# Vivado block design aurora_gty_47drto13p, xczu47dr-ffvg1517-2-i, Vivado 2025.2
# (continued, part 2 of 3)
current_bd_instance /hier_tx_x0y3/tx_c0
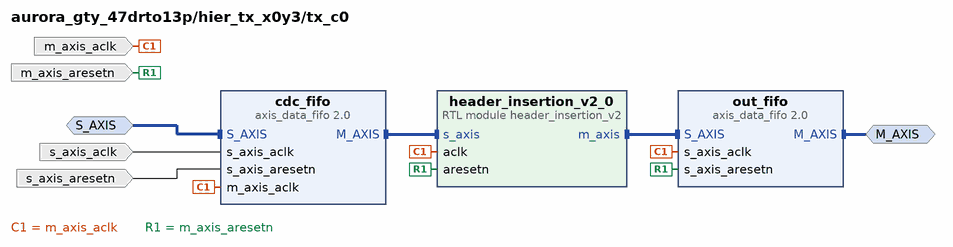
[diagram p24: block diagram inside /hier_tx_x0y3/tx_c0]
create_bd_intf_pin -mode Slave -vlnv xilinx.com:interface:axis_rtl:1.0 S_AXIS
create_bd_intf_pin -mode Master -vlnv xilinx.com:interface:axis_rtl:1.0 M_AXIS
create_bd_pin -dir I -type clk m_axis_aclk
create_bd_pin -dir I -type rst m_axis_aresetn
create_bd_pin -dir I s_axis_aresetn
create_bd_pin -dir I -type clk s_axis_aclk

create_bd_cell -type module -reference header_insertion_v2 header_insertion_v2_0
create_bd_cell -type ip -vlnv xilinx.com:ip:axis_data_fifo:2.0 cdc_fifo
set_property -dict [list \
  CONFIG.FIFO_DEPTH 16 \
  CONFIG.HAS_TLAST 1 \
  CONFIG.IS_ACLK_ASYNC 1 \
  CONFIG.TDATA_NUM_BYTES 20 \
  CONFIG.TUSER_WIDTH 64 \
] [get_bd_cells cdc_fifo]
create_bd_cell -type ip -vlnv xilinx.com:ip:axis_data_fifo:2.0 out_fifo
set_property -dict {CONFIG.FIFO_DEPTH 16 CONFIG.HAS_TLAST 1 CONFIG.TDATA_NUM_BYTES 16} [get_bd_cells out_fifo]

# ---- hierarchy /hier_tx_x0y3/tx_c1 ----
current_bd_instance /hier_tx_x0y3/tx_c1
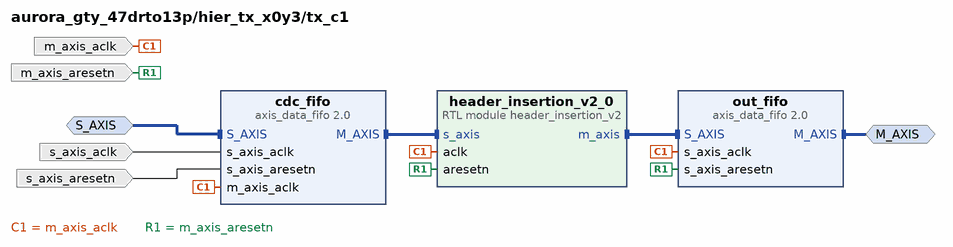
[diagram p25: block diagram inside /hier_tx_x0y3/tx_c1]
create_bd_intf_pin -mode Slave -vlnv xilinx.com:interface:axis_rtl:1.0 S_AXIS
create_bd_intf_pin -mode Master -vlnv xilinx.com:interface:axis_rtl:1.0 M_AXIS
create_bd_pin -dir I -type clk m_axis_aclk
create_bd_pin -dir I -type rst m_axis_aresetn
create_bd_pin -dir I s_axis_aresetn
create_bd_pin -dir I -type clk s_axis_aclk

create_bd_cell -type module -reference header_insertion_v2 header_insertion_v2_0
create_bd_cell -type ip -vlnv xilinx.com:ip:axis_data_fifo:2.0 cdc_fifo
set_property -dict [list \
  CONFIG.FIFO_DEPTH 16 \
  CONFIG.HAS_TLAST 1 \
  CONFIG.IS_ACLK_ASYNC 1 \
  CONFIG.TDATA_NUM_BYTES 20 \
  CONFIG.TUSER_WIDTH 64 \
] [get_bd_cells cdc_fifo]
create_bd_cell -type ip -vlnv xilinx.com:ip:axis_data_fifo:2.0 out_fifo
set_property -dict {CONFIG.FIFO_DEPTH 16 CONFIG.HAS_TLAST 1 CONFIG.TDATA_NUM_BYTES 16} [get_bd_cells out_fifo]

# ---- hierarchy /hier_tx_x0y4 ----
current_bd_instance /hier_tx_x0y4
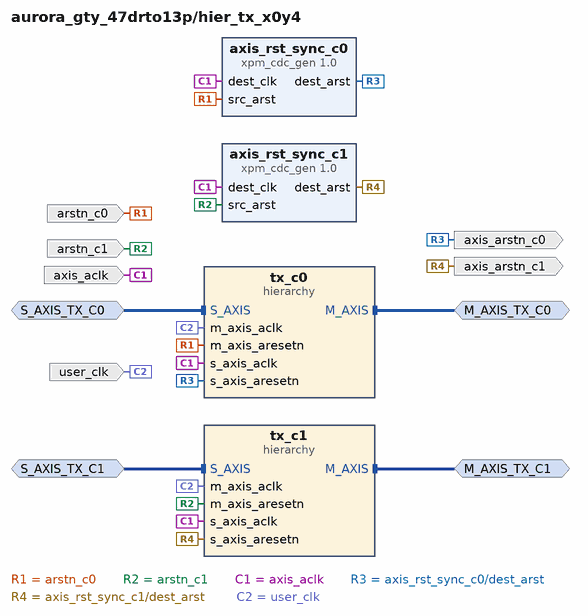
[diagram p26: block diagram inside /hier_tx_x0y4]
create_bd_intf_pin -mode Master -vlnv xilinx.com:interface:axis_rtl:1.0 M_AXIS_TX_C0
create_bd_intf_pin -mode Master -vlnv xilinx.com:interface:axis_rtl:1.0 M_AXIS_TX_C1
create_bd_intf_pin -mode Slave -vlnv xilinx.com:interface:axis_rtl:1.0 S_AXIS_TX_C1
create_bd_intf_pin -mode Slave -vlnv xilinx.com:interface:axis_rtl:1.0 S_AXIS_TX_C0
create_bd_pin -dir I -type clk user_clk
create_bd_pin -dir I -type clk axis_aclk
create_bd_pin -dir O -type rst axis_arstn_c0
create_bd_pin -dir O -type rst axis_arstn_c1
create_bd_pin -dir I -type rst arstn_c1
create_bd_pin -dir I -type rst arstn_c0

create_bd_cell -type ip -vlnv xilinx.com:ip:xpm_cdc_gen:1.0 axis_rst_sync_c0
set_property -dict {CONFIG.CDC_TYPE xpm_cdc_async_rst} [get_bd_cells axis_rst_sync_c0]
create_bd_cell -type ip -vlnv xilinx.com:ip:xpm_cdc_gen:1.0 axis_rst_sync_c1
set_property -dict {CONFIG.CDC_TYPE xpm_cdc_async_rst} [get_bd_cells axis_rst_sync_c1]
create_bd_cell -type hier tx_c0
create_bd_cell -type hier tx_c1

# ---- hierarchy /hier_tx_x0y4/tx_c0 ----
current_bd_instance /hier_tx_x0y4/tx_c0
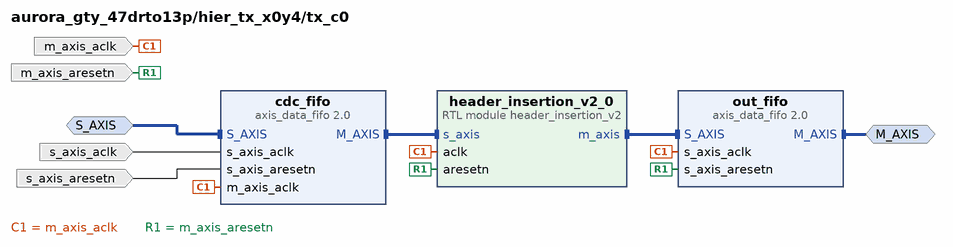
[diagram p27: block diagram inside /hier_tx_x0y4/tx_c0]
create_bd_intf_pin -mode Slave -vlnv xilinx.com:interface:axis_rtl:1.0 S_AXIS
create_bd_intf_pin -mode Master -vlnv xilinx.com:interface:axis_rtl:1.0 M_AXIS
create_bd_pin -dir I -type clk m_axis_aclk
create_bd_pin -dir I -type rst m_axis_aresetn
create_bd_pin -dir I s_axis_aresetn
create_bd_pin -dir I -type clk s_axis_aclk

create_bd_cell -type module -reference header_insertion_v2 header_insertion_v2_0
create_bd_cell -type ip -vlnv xilinx.com:ip:axis_data_fifo:2.0 cdc_fifo
set_property -dict [list \
  CONFIG.FIFO_DEPTH 16 \
  CONFIG.HAS_TLAST 1 \
  CONFIG.IS_ACLK_ASYNC 1 \
  CONFIG.TDATA_NUM_BYTES 20 \
  CONFIG.TUSER_WIDTH 64 \
] [get_bd_cells cdc_fifo]
create_bd_cell -type ip -vlnv xilinx.com:ip:axis_data_fifo:2.0 out_fifo
set_property -dict {CONFIG.FIFO_DEPTH 16 CONFIG.HAS_TLAST 1 CONFIG.TDATA_NUM_BYTES 16} [get_bd_cells out_fifo]

# ---- hierarchy /hier_tx_x0y4/tx_c1 ----
current_bd_instance /hier_tx_x0y4/tx_c1
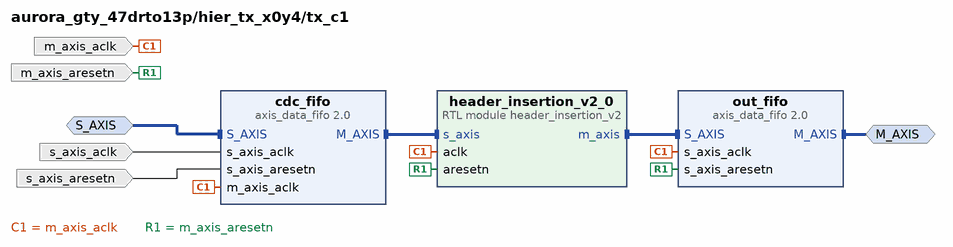
[diagram p28: block diagram inside /hier_tx_x0y4/tx_c1]
create_bd_intf_pin -mode Slave -vlnv xilinx.com:interface:axis_rtl:1.0 S_AXIS
create_bd_intf_pin -mode Master -vlnv xilinx.com:interface:axis_rtl:1.0 M_AXIS
create_bd_pin -dir I -type clk m_axis_aclk
create_bd_pin -dir I -type rst m_axis_aresetn
create_bd_pin -dir I s_axis_aresetn
create_bd_pin -dir I -type clk s_axis_aclk

create_bd_cell -type module -reference header_insertion_v2 header_insertion_v2_0
create_bd_cell -type ip -vlnv xilinx.com:ip:axis_data_fifo:2.0 cdc_fifo
set_property -dict [list \
  CONFIG.FIFO_DEPTH 16 \
  CONFIG.HAS_TLAST 1 \
  CONFIG.IS_ACLK_ASYNC 1 \
  CONFIG.TDATA_NUM_BYTES 20 \
  CONFIG.TUSER_WIDTH 64 \
] [get_bd_cells cdc_fifo]
create_bd_cell -type ip -vlnv xilinx.com:ip:axis_data_fifo:2.0 out_fifo
set_property -dict {CONFIG.FIFO_DEPTH 16 CONFIG.HAS_TLAST 1 CONFIG.TDATA_NUM_BYTES 16} [get_bd_cells out_fifo]

# ---- connections ----

current_bd_instance /hier_x0y1
connect_bd_intf_net [get_bd_intf_pins aurora_x0y1_0/GT_DIFF_REFCLK1] [get_bd_intf_pins GT_REFCLK]
connect_bd_intf_net [get_bd_intf_pins aurora_x0y1_0/GT_SERIAL_RX] [get_bd_intf_pins GT_SERIAL_RX_C0]
connect_bd_intf_net [get_bd_intf_pins aurora_x0y1_1/GT_SERIAL_RX] [get_bd_intf_pins GT_SERIAL_RX_C1]
connect_bd_intf_net [get_bd_intf_pins S_AXIS_TX_C0] [get_bd_intf_pins aurora_x0y1_0/USER_DATA_S_AXIS_TX]
connect_bd_intf_net [get_bd_intf_pins S_AXIS_TX_C1] [get_bd_intf_pins aurora_x0y1_1/USER_DATA_S_AXIS_TX]
connect_bd_intf_net [get_bd_intf_pins aurora_x0y1_0/GT_SERIAL_TX] [get_bd_intf_pins GT_SERIAL_TX_C0]
connect_bd_intf_net [get_bd_intf_pins M_AXIS_RX_C0] [get_bd_intf_pins aurora_x0y1_0/USER_DATA_M_AXIS_RX]
connect_bd_intf_net [get_bd_intf_pins aurora_x0y1_1/GT_SERIAL_TX] [get_bd_intf_pins GT_SERIAL_TX_C1]
connect_bd_intf_net [get_bd_intf_pins M_AXIS_RX_C1] [get_bd_intf_pins aurora_x0y1_1/USER_DATA_M_AXIS_RX]
connect_bd_net [get_bd_pins aurora_rstn_0/arstn] [get_bd_pins arstn_c0]
connect_bd_net [get_bd_pins aurora_rstn_1/arstn] [get_bd_pins arstn_c1]
connect_bd_net [get_bd_pins aurora_x0y1_0/channel_up] [get_bd_pins aurora_rstn_0/channel_up] [get_bd_pins x0y1_core_status_0/probe_in0]
connect_bd_net [get_bd_pins aurora_x0y1_0/gt_pll_lock] [get_bd_pins auto_reset_aurora/pll_lock] [get_bd_pins x0y1_core_status_0/probe_in1]
connect_bd_net [get_bd_pins aurora_x0y1_0/gt_qpllclk_quad1_out] [get_bd_pins aurora_x0y1_1/gt_qpllclk_quad1_in]
connect_bd_net [get_bd_pins aurora_x0y1_0/gt_qplllock_quad1_out] [get_bd_pins aurora_x0y1_1/gt_qplllock_quad1_in]
connect_bd_net [get_bd_pins aurora_x0y1_0/gt_qpllrefclk_quad1_out] [get_bd_pins aurora_x0y1_1/gt_qpllrefclk_quad1_in]
connect_bd_net [get_bd_pins aurora_x0y1_0/gt_qpllrefclklost_quad1_out] [get_bd_pins aurora_x0y1_1/gt_qpllrefclklost_quad1]
connect_bd_net [get_bd_pins aurora_x0y1_0/gt_refclk1_out] [get_bd_pins aurora_x0y1_1/refclk1_in]
connect_bd_net [get_bd_pins aurora_x0y1_0/gt_reset_out] [get_bd_pins aurora_x0y1_1/pma_init]
connect_bd_net [get_bd_pins aurora_x0y1_0/lane_up] [get_bd_pins x0y1_core_status_0/probe_in2]
connect_bd_net [get_bd_pins aurora_x0y1_0/mmcm_not_locked_out] [get_bd_pins aurora_x0y1_1/mmcm_not_locked]
connect_bd_net [get_bd_pins aurora_x0y1_0/sync_clk_out] [get_bd_pins aurora_x0y1_1/sync_clk]
connect_bd_net [get_bd_pins aurora_x0y1_0/sys_reset_out] [get_bd_pins aurora_rstn_0/system_rst] [get_bd_pins aurora_x0y1_1/reset_pb]
connect_bd_net [get_bd_pins aurora_x0y1_0/user_clk_out] \
  [get_bd_pins user_clk_out] [get_bd_pins aurora_x0y1_1/user_clk] [get_bd_pins x0y1_core_status_0/clk] \
  [get_bd_pins x0y1_core_status_1/clk]
connect_bd_net [get_bd_pins aurora_x0y1_1/channel_up] [get_bd_pins aurora_rstn_1/channel_up] [get_bd_pins x0y1_core_status_1/probe_in0]
connect_bd_net [get_bd_pins aurora_x0y1_1/gt_pll_lock] [get_bd_pins x0y1_core_status_1/probe_in1]
connect_bd_net [get_bd_pins aurora_x0y1_1/lane_up] [get_bd_pins x0y1_core_status_1/probe_in2]
connect_bd_net [get_bd_pins aurora_x0y1_1/sys_reset_out] [get_bd_pins aurora_rstn_1/system_rst]
connect_bd_net [get_bd_pins auto_reset_aurora/reset_pb] [get_bd_pins aurora_x0y1_0/reset_pb]
connect_bd_net [get_bd_pins init_clk] [get_bd_pins auto_reset_aurora/i_clk] [get_bd_pins aurora_x0y1_0/init_clk] [get_bd_pins aurora_x0y1_1/init_clk]
connect_bd_net [get_bd_pins pma_init] [get_bd_pins aurora_x0y1_0/pma_init]

current_bd_instance /hier_tx_x0y1
connect_bd_intf_net [get_bd_intf_pins tx_c0/S_AXIS] [get_bd_intf_pins S_AXIS_TX_C0]
connect_bd_intf_net [get_bd_intf_pins tx_c1/S_AXIS] [get_bd_intf_pins S_AXIS_TX_C1]
connect_bd_intf_net [get_bd_intf_pins M_AXIS_TX_C0] [get_bd_intf_pins tx_c0/M_AXIS]
connect_bd_intf_net [get_bd_intf_pins M_AXIS_TX_C1] [get_bd_intf_pins tx_c1/M_AXIS]
connect_bd_net [get_bd_pins arstn_c0] [get_bd_pins tx_c0/m_axis_aresetn] [get_bd_pins axis_rst_sync_c0/src_arst]
connect_bd_net [get_bd_pins arstn_c1] [get_bd_pins tx_c1/m_axis_aresetn] [get_bd_pins axis_rst_sync_c1/src_arst]
connect_bd_net [get_bd_pins axis_aclk] \
  [get_bd_pins tx_c0/s_axis_aclk] [get_bd_pins tx_c1/s_axis_aclk] [get_bd_pins axis_rst_sync_c0/dest_clk] \
  [get_bd_pins axis_rst_sync_c1/dest_clk]
connect_bd_net [get_bd_pins axis_rst_sync_c0/dest_arst] [get_bd_pins axis_arstn_c0] [get_bd_pins tx_c0/s_axis_aresetn]
connect_bd_net [get_bd_pins axis_rst_sync_c1/dest_arst] [get_bd_pins axis_arstn_c1] [get_bd_pins tx_c1/s_axis_aresetn]
connect_bd_net [get_bd_pins user_clk] [get_bd_pins tx_c0/m_axis_aclk] [get_bd_pins tx_c1/m_axis_aclk]

current_bd_instance /hier_tx_x0y1/tx_c0
connect_bd_intf_net [get_bd_intf_pins S_AXIS] [get_bd_intf_pins cdc_fifo/S_AXIS]
connect_bd_intf_net [get_bd_intf_pins cdc_fifo/M_AXIS] [get_bd_intf_pins header_insertion_v2_0/s_axis]
connect_bd_intf_net [get_bd_intf_pins header_insertion_v2_0/m_axis] [get_bd_intf_pins out_fifo/S_AXIS]
connect_bd_intf_net [get_bd_intf_pins M_AXIS] [get_bd_intf_pins out_fifo/M_AXIS]
connect_bd_net [get_bd_pins m_axis_aclk] \
  [get_bd_pins header_insertion_v2_0/aclk] [get_bd_pins cdc_fifo/m_axis_aclk] [get_bd_pins out_fifo/s_axis_aclk]
connect_bd_net [get_bd_pins m_axis_aresetn] [get_bd_pins header_insertion_v2_0/aresetn] [get_bd_pins out_fifo/s_axis_aresetn]
connect_bd_net [get_bd_pins s_axis_aclk] [get_bd_pins cdc_fifo/s_axis_aclk]
connect_bd_net [get_bd_pins s_axis_aresetn] [get_bd_pins cdc_fifo/s_axis_aresetn]

current_bd_instance /hier_tx_x0y1/tx_c1
connect_bd_intf_net [get_bd_intf_pins S_AXIS] [get_bd_intf_pins cdc_fifo/S_AXIS]
connect_bd_intf_net [get_bd_intf_pins cdc_fifo/M_AXIS] [get_bd_intf_pins header_insertion_v2_0/s_axis]
connect_bd_intf_net [get_bd_intf_pins header_insertion_v2_0/m_axis] [get_bd_intf_pins out_fifo/S_AXIS]
connect_bd_intf_net [get_bd_intf_pins M_AXIS] [get_bd_intf_pins out_fifo/M_AXIS]
connect_bd_net [get_bd_pins m_axis_aclk] \
  [get_bd_pins header_insertion_v2_0/aclk] [get_bd_pins cdc_fifo/m_axis_aclk] [get_bd_pins out_fifo/s_axis_aclk]
connect_bd_net [get_bd_pins m_axis_aresetn] [get_bd_pins header_insertion_v2_0/aresetn] [get_bd_pins out_fifo/s_axis_aresetn]
connect_bd_net [get_bd_pins s_axis_aclk] [get_bd_pins cdc_fifo/s_axis_aclk]
connect_bd_net [get_bd_pins s_axis_aresetn] [get_bd_pins cdc_fifo/s_axis_aresetn]

current_bd_instance /hier_tx_x0y2
connect_bd_intf_net [get_bd_intf_pins tx_c0/S_AXIS] [get_bd_intf_pins S_AXIS_TX_C0]
connect_bd_intf_net [get_bd_intf_pins tx_c1/S_AXIS] [get_bd_intf_pins S_AXIS_TX_C1]
connect_bd_intf_net [get_bd_intf_pins M_AXIS_TX_C0] [get_bd_intf_pins tx_c0/M_AXIS]
connect_bd_intf_net [get_bd_intf_pins M_AXIS_TX_C1] [get_bd_intf_pins tx_c1/M_AXIS]
connect_bd_net [get_bd_pins arstn_c0] [get_bd_pins tx_c0/m_axis_aresetn] [get_bd_pins axis_rst_sync_c0/src_arst]
connect_bd_net [get_bd_pins arstn_c1] [get_bd_pins tx_c1/m_axis_aresetn] [get_bd_pins axis_rst_sync_c1/src_arst]
connect_bd_net [get_bd_pins axis_aclk] \
  [get_bd_pins tx_c0/s_axis_aclk] [get_bd_pins tx_c1/s_axis_aclk] [get_bd_pins axis_rst_sync_c0/dest_clk] \
  [get_bd_pins axis_rst_sync_c1/dest_clk]
connect_bd_net [get_bd_pins axis_rst_sync_c0/dest_arst] [get_bd_pins axis_arstn_c0] [get_bd_pins tx_c0/s_axis_aresetn]
connect_bd_net [get_bd_pins axis_rst_sync_c1/dest_arst] [get_bd_pins axis_arstn_c1] [get_bd_pins tx_c1/s_axis_aresetn]
connect_bd_net [get_bd_pins user_clk] [get_bd_pins tx_c0/m_axis_aclk] [get_bd_pins tx_c1/m_axis_aclk]

current_bd_instance /hier_tx_x0y2/tx_c0
connect_bd_intf_net [get_bd_intf_pins S_AXIS] [get_bd_intf_pins cdc_fifo/S_AXIS]
connect_bd_intf_net [get_bd_intf_pins cdc_fifo/M_AXIS] [get_bd_intf_pins header_insertion_v2_0/s_axis]
connect_bd_intf_net [get_bd_intf_pins header_insertion_v2_0/m_axis] [get_bd_intf_pins out_fifo/S_AXIS]
connect_bd_intf_net [get_bd_intf_pins M_AXIS] [get_bd_intf_pins out_fifo/M_AXIS]
connect_bd_net [get_bd_pins m_axis_aclk] \
  [get_bd_pins header_insertion_v2_0/aclk] [get_bd_pins cdc_fifo/m_axis_aclk] [get_bd_pins out_fifo/s_axis_aclk]
connect_bd_net [get_bd_pins m_axis_aresetn] [get_bd_pins header_insertion_v2_0/aresetn] [get_bd_pins out_fifo/s_axis_aresetn]
connect_bd_net [get_bd_pins s_axis_aclk] [get_bd_pins cdc_fifo/s_axis_aclk]
connect_bd_net [get_bd_pins s_axis_aresetn] [get_bd_pins cdc_fifo/s_axis_aresetn]

current_bd_instance /hier_tx_x0y2/tx_c1
connect_bd_intf_net [get_bd_intf_pins S_AXIS] [get_bd_intf_pins cdc_fifo/S_AXIS]
connect_bd_intf_net [get_bd_intf_pins cdc_fifo/M_AXIS] [get_bd_intf_pins header_insertion_v2_0/s_axis]
connect_bd_intf_net [get_bd_intf_pins header_insertion_v2_0/m_axis] [get_bd_intf_pins out_fifo/S_AXIS]
connect_bd_intf_net [get_bd_intf_pins M_AXIS] [get_bd_intf_pins out_fifo/M_AXIS]
connect_bd_net [get_bd_pins m_axis_aclk] \
  [get_bd_pins header_insertion_v2_0/aclk] [get_bd_pins cdc_fifo/m_axis_aclk] [get_bd_pins out_fifo/s_axis_aclk]
connect_bd_net [get_bd_pins m_axis_aresetn] [get_bd_pins header_insertion_v2_0/aresetn] [get_bd_pins out_fifo/s_axis_aresetn]
connect_bd_net [get_bd_pins s_axis_aclk] [get_bd_pins cdc_fifo/s_axis_aclk]
connect_bd_net [get_bd_pins s_axis_aresetn] [get_bd_pins cdc_fifo/s_axis_aresetn]

current_bd_instance /hier_rx_x0y1
connect_bd_intf_net [get_bd_intf_pins S_AXIS_RX_C0] [get_bd_intf_pins rx_c0/S_AXIS]
connect_bd_intf_net [get_bd_intf_pins S_AXIS_RX_C1] [get_bd_intf_pins rx_c1/S_AXIS]
connect_bd_intf_net [get_bd_intf_pins rx_c0/M_AXIS] [get_bd_intf_pins M_AXIS_RX_C0]
connect_bd_intf_net [get_bd_intf_pins rx_c1/M_AXIS] [get_bd_intf_pins M_AXIS_RX_C1]
connect_bd_net [get_bd_pins arstn_c0] [get_bd_pins rx_c0/s_axis_aresetn]
connect_bd_net [get_bd_pins arstn_c1] [get_bd_pins rx_c1/s_axis_aresetn]
connect_bd_net [get_bd_pins axis_aclk] [get_bd_pins rx_c0/m_axis_aclk] [get_bd_pins rx_c1/m_axis_aclk]
connect_bd_net [get_bd_pins user_clk] [get_bd_pins rx_c0/s_axis_aclk] [get_bd_pins rx_c1/s_axis_aclk]

current_bd_instance /hier_rx_x0y1/rx_c0
connect_bd_intf_net [get_bd_intf_pins S_AXIS] [get_bd_intf_pins in_fifo/S_AXIS]
connect_bd_intf_net [get_bd_intf_pins S_AXIS] [get_bd_intf_pins system_ila_0/SLOT_0_AXIS]
connect_bd_intf_net [get_bd_intf_pins M_AXIS] [get_bd_intf_pins cdc_fifo/M_AXIS]
connect_bd_intf_net [get_bd_intf_pins header_extraction_v2_0/m_axis] [get_bd_intf_pins cdc_fifo/S_AXIS]
connect_bd_intf_net [get_bd_intf_pins header_extraction_v2_0/m_axis] [get_bd_intf_pins system_ila_0/SLOT_2_AXIS]
connect_bd_intf_net [get_bd_intf_pins in_fifo/M_AXIS] [get_bd_intf_pins header_extraction_v2_0/s_axis]
connect_bd_intf_net [get_bd_intf_pins in_fifo/M_AXIS] [get_bd_intf_pins system_ila_0/SLOT_1_AXIS]
connect_bd_net [get_bd_pins header_extraction_v2_0/err] [get_bd_pins system_ila_0/probe1]
connect_bd_net [get_bd_pins header_extraction_v2_0/header] [get_bd_pins system_ila_0/probe0]
connect_bd_net [get_bd_pins m_axis_aclk] [get_bd_pins cdc_fifo/m_axis_aclk]
connect_bd_net [get_bd_pins s_axis_aclk] \
  [get_bd_pins header_extraction_v2_0/aclk] [get_bd_pins in_fifo/s_axis_aclk] [get_bd_pins cdc_fifo/s_axis_aclk] \
  [get_bd_pins system_ila_0/clk]
connect_bd_net [get_bd_pins s_axis_aresetn] \
  [get_bd_pins header_extraction_v2_0/aresetn] [get_bd_pins in_fifo/s_axis_aresetn] [get_bd_pins cdc_fifo/s_axis_aresetn] \
  [get_bd_pins system_ila_0/resetn]

current_bd_instance /hier_rx_x0y1/rx_c1
connect_bd_intf_net [get_bd_intf_pins S_AXIS] [get_bd_intf_pins in_fifo/S_AXIS]
connect_bd_intf_net [get_bd_intf_pins M_AXIS] [get_bd_intf_pins cdc_fifo/M_AXIS]
connect_bd_intf_net [get_bd_intf_pins header_extraction_v2_0/m_axis] [get_bd_intf_pins cdc_fifo/S_AXIS]
connect_bd_intf_net [get_bd_intf_pins in_fifo/M_AXIS] [get_bd_intf_pins header_extraction_v2_0/s_axis]
connect_bd_net [get_bd_pins m_axis_aclk] [get_bd_pins cdc_fifo/m_axis_aclk]
connect_bd_net [get_bd_pins s_axis_aclk] \
  [get_bd_pins header_extraction_v2_0/aclk] [get_bd_pins in_fifo/s_axis_aclk] [get_bd_pins cdc_fifo/s_axis_aclk]
connect_bd_net [get_bd_pins s_axis_aresetn] \
  [get_bd_pins header_extraction_v2_0/aresetn] [get_bd_pins in_fifo/s_axis_aresetn] [get_bd_pins cdc_fifo/s_axis_aresetn]

current_bd_instance /hier_x0y2
connect_bd_intf_net [get_bd_intf_pins aurora_x0y2_0/GT_DIFF_REFCLK1] [get_bd_intf_pins GT_REFCLK]
connect_bd_intf_net [get_bd_intf_pins aurora_x0y2_0/GT_SERIAL_RX] [get_bd_intf_pins GT_SERIAL_RX_C0]
connect_bd_intf_net [get_bd_intf_pins aurora_x0y2_1/GT_SERIAL_RX] [get_bd_intf_pins GT_SERIAL_RX_C1]
connect_bd_intf_net [get_bd_intf_pins S_AXIS_TX_C0] [get_bd_intf_pins aurora_x0y2_0/USER_DATA_S_AXIS_TX]
connect_bd_intf_net [get_bd_intf_pins S_AXIS_TX_C1] [get_bd_intf_pins aurora_x0y2_1/USER_DATA_S_AXIS_TX]
connect_bd_intf_net [get_bd_intf_pins aurora_x0y2_0/GT_SERIAL_TX] [get_bd_intf_pins GT_SERIAL_TX_C0]
connect_bd_intf_net [get_bd_intf_pins M_AXIS_RX_C0] [get_bd_intf_pins aurora_x0y2_0/USER_DATA_M_AXIS_RX]
connect_bd_intf_net [get_bd_intf_pins aurora_x0y2_1/GT_SERIAL_TX] [get_bd_intf_pins GT_SERIAL_TX_C1]
connect_bd_intf_net [get_bd_intf_pins M_AXIS_RX_C1] [get_bd_intf_pins aurora_x0y2_1/USER_DATA_M_AXIS_RX]
connect_bd_net [get_bd_pins aurora_rstn_0/arstn] [get_bd_pins arstn_c0]
connect_bd_net [get_bd_pins aurora_rstn_1/arstn] [get_bd_pins arstn_c1]
connect_bd_net [get_bd_pins aurora_x0y2_0/channel_up] [get_bd_pins aurora_rstn_0/channel_up] [get_bd_pins x0y2_core_status_0/probe_in0]
connect_bd_net [get_bd_pins aurora_x0y2_0/gt_pll_lock] [get_bd_pins auto_reset_aurora/pll_lock] [get_bd_pins x0y2_core_status_0/probe_in1]
connect_bd_net [get_bd_pins aurora_x0y2_0/gt_qpllclk_quad1_out] [get_bd_pins aurora_x0y2_1/gt_qpllclk_quad1_in]
connect_bd_net [get_bd_pins aurora_x0y2_0/gt_qplllock_quad1_out] [get_bd_pins aurora_x0y2_1/gt_qplllock_quad1_in]
connect_bd_net [get_bd_pins aurora_x0y2_0/gt_qpllrefclk_quad1_out] [get_bd_pins aurora_x0y2_1/gt_qpllrefclk_quad1_in]
connect_bd_net [get_bd_pins aurora_x0y2_0/gt_qpllrefclklost_quad1_out] [get_bd_pins aurora_x0y2_1/gt_qpllrefclklost_quad1]
connect_bd_net [get_bd_pins aurora_x0y2_0/gt_refclk1_out] [get_bd_pins aurora_x0y2_1/refclk1_in]
connect_bd_net [get_bd_pins aurora_x0y2_0/gt_reset_out] [get_bd_pins aurora_x0y2_1/pma_init]
connect_bd_net [get_bd_pins aurora_x0y2_0/lane_up] [get_bd_pins x0y2_core_status_0/probe_in2]
connect_bd_net [get_bd_pins aurora_x0y2_0/mmcm_not_locked_out] [get_bd_pins aurora_x0y2_1/mmcm_not_locked]
connect_bd_net [get_bd_pins aurora_x0y2_0/sync_clk_out] [get_bd_pins aurora_x0y2_1/sync_clk]
connect_bd_net [get_bd_pins aurora_x0y2_0/sys_reset_out] [get_bd_pins aurora_rstn_0/system_rst] [get_bd_pins aurora_x0y2_1/reset_pb]
connect_bd_net [get_bd_pins aurora_x0y2_0/user_clk_out] \
  [get_bd_pins user_clk_out] [get_bd_pins aurora_x0y2_1/user_clk] [get_bd_pins x0y2_core_status_0/clk] \
  [get_bd_pins x0y2_core_status_1/clk]
connect_bd_net [get_bd_pins aurora_x0y2_1/channel_up] [get_bd_pins aurora_rstn_1/channel_up] [get_bd_pins x0y2_core_status_1/probe_in0]
connect_bd_net [get_bd_pins aurora_x0y2_1/gt_pll_lock] [get_bd_pins x0y2_core_status_1/probe_in1]
connect_bd_net [get_bd_pins aurora_x0y2_1/lane_up] [get_bd_pins x0y2_core_status_1/probe_in2]
connect_bd_net [get_bd_pins aurora_x0y2_1/sys_reset_out] [get_bd_pins aurora_rstn_1/system_rst]
connect_bd_net [get_bd_pins auto_reset_aurora/reset_pb] [get_bd_pins aurora_x0y2_0/reset_pb]
connect_bd_net [get_bd_pins init_clk] [get_bd_pins auto_reset_aurora/i_clk] [get_bd_pins aurora_x0y2_0/init_clk] [get_bd_pins aurora_x0y2_1/init_clk]
connect_bd_net [get_bd_pins pma_init] [get_bd_pins aurora_x0y2_0/pma_init]

current_bd_instance /hier_rx_x0y2
connect_bd_intf_net [get_bd_intf_pins S_AXIS_RX_C0] [get_bd_intf_pins rx_c0/S_AXIS]
connect_bd_intf_net [get_bd_intf_pins S_AXIS_RX_C1] [get_bd_intf_pins rx_c1/S_AXIS]
connect_bd_intf_net [get_bd_intf_pins rx_c0/M_AXIS] [get_bd_intf_pins M_AXIS_RX_C0]
connect_bd_intf_net [get_bd_intf_pins rx_c1/M_AXIS] [get_bd_intf_pins M_AXIS_RX_C1]
connect_bd_net [get_bd_pins arstn_c0] [get_bd_pins rx_c0/s_axis_aresetn]
connect_bd_net [get_bd_pins arstn_c1] [get_bd_pins rx_c1/s_axis_aresetn]
connect_bd_net [get_bd_pins axis_aclk] [get_bd_pins rx_c0/m_axis_aclk] [get_bd_pins rx_c1/m_axis_aclk]
connect_bd_net [get_bd_pins user_clk] [get_bd_pins rx_c0/s_axis_aclk] [get_bd_pins rx_c1/s_axis_aclk]

current_bd_instance /hier_rx_x0y2/rx_c0
connect_bd_intf_net [get_bd_intf_pins S_AXIS] [get_bd_intf_pins in_fifo/S_AXIS]
connect_bd_intf_net [get_bd_intf_pins M_AXIS] [get_bd_intf_pins cdc_fifo/M_AXIS]
connect_bd_intf_net [get_bd_intf_pins header_extraction_v2_0/m_axis] [get_bd_intf_pins cdc_fifo/S_AXIS]
connect_bd_intf_net [get_bd_intf_pins in_fifo/M_AXIS] [get_bd_intf_pins header_extraction_v2_0/s_axis]
connect_bd_net [get_bd_pins m_axis_aclk] [get_bd_pins cdc_fifo/m_axis_aclk]
connect_bd_net [get_bd_pins s_axis_aclk] \
  [get_bd_pins header_extraction_v2_0/aclk] [get_bd_pins in_fifo/s_axis_aclk] [get_bd_pins cdc_fifo/s_axis_aclk]
connect_bd_net [get_bd_pins s_axis_aresetn] \
  [get_bd_pins header_extraction_v2_0/aresetn] [get_bd_pins in_fifo/s_axis_aresetn] [get_bd_pins cdc_fifo/s_axis_aresetn]

current_bd_instance /hier_rx_x0y2/rx_c1
connect_bd_intf_net [get_bd_intf_pins S_AXIS] [get_bd_intf_pins in_fifo/S_AXIS]
connect_bd_intf_net [get_bd_intf_pins M_AXIS] [get_bd_intf_pins cdc_fifo/M_AXIS]
connect_bd_intf_net [get_bd_intf_pins header_extraction_v2_0/m_axis] [get_bd_intf_pins cdc_fifo/S_AXIS]
connect_bd_intf_net [get_bd_intf_pins in_fifo/M_AXIS] [get_bd_intf_pins header_extraction_v2_0/s_axis]
connect_bd_net [get_bd_pins m_axis_aclk] [get_bd_pins cdc_fifo/m_axis_aclk]
connect_bd_net [get_bd_pins s_axis_aclk] \
  [get_bd_pins header_extraction_v2_0/aclk] [get_bd_pins in_fifo/s_axis_aclk] [get_bd_pins cdc_fifo/s_axis_aclk]
connect_bd_net [get_bd_pins s_axis_aresetn] \
  [get_bd_pins header_extraction_v2_0/aresetn] [get_bd_pins in_fifo/s_axis_aresetn] [get_bd_pins cdc_fifo/s_axis_aresetn]

current_bd_instance /hier_x0y3
connect_bd_intf_net [get_bd_intf_pins aurora_x0y3_0/GT_DIFF_REFCLK1] [get_bd_intf_pins GT_REFCLK]
connect_bd_intf_net [get_bd_intf_pins aurora_x0y3_0/GT_SERIAL_RX] [get_bd_intf_pins GT_SERIAL_RX_C0]
connect_bd_intf_net [get_bd_intf_pins aurora_x0y3_1/GT_SERIAL_RX] [get_bd_intf_pins GT_SERIAL_RX_C1]
connect_bd_intf_net [get_bd_intf_pins S_AXIS_TX_C0] [get_bd_intf_pins aurora_x0y3_0/USER_DATA_S_AXIS_TX]
connect_bd_intf_net [get_bd_intf_pins S_AXIS_TX_C1] [get_bd_intf_pins aurora_x0y3_1/USER_DATA_S_AXIS_TX]
connect_bd_intf_net [get_bd_intf_pins aurora_x0y3_0/GT_SERIAL_TX] [get_bd_intf_pins GT_SERIAL_TX_C0]
connect_bd_intf_net [get_bd_intf_pins M_AXIS_RX_C0] [get_bd_intf_pins aurora_x0y3_0/USER_DATA_M_AXIS_RX]
connect_bd_intf_net [get_bd_intf_pins aurora_x0y3_1/GT_SERIAL_TX] [get_bd_intf_pins GT_SERIAL_TX_C1]
connect_bd_intf_net [get_bd_intf_pins M_AXIS_RX_C1] [get_bd_intf_pins aurora_x0y3_1/USER_DATA_M_AXIS_RX]
connect_bd_net [get_bd_pins aurora_rstn_0/arstn] [get_bd_pins arstn_c0]
connect_bd_net [get_bd_pins aurora_rstn_1/arstn] [get_bd_pins arstn_c1]
connect_bd_net [get_bd_pins aurora_x0y3_0/channel_up] [get_bd_pins aurora_rstn_0/channel_up] [get_bd_pins x0y3_core_status_0/probe_in0]
connect_bd_net [get_bd_pins aurora_x0y3_0/gt_pll_lock] [get_bd_pins auto_reset_aurora/pll_lock] [get_bd_pins x0y3_core_status_0/probe_in1]
connect_bd_net [get_bd_pins aurora_x0y3_0/gt_qpllclk_quad1_out] [get_bd_pins aurora_x0y3_1/gt_qpllclk_quad1_in]
connect_bd_net [get_bd_pins aurora_x0y3_0/gt_qplllock_quad1_out] [get_bd_pins aurora_x0y3_1/gt_qplllock_quad1_in]
connect_bd_net [get_bd_pins aurora_x0y3_0/gt_qpllrefclk_quad1_out] [get_bd_pins aurora_x0y3_1/gt_qpllrefclk_quad1_in]
connect_bd_net [get_bd_pins aurora_x0y3_0/gt_qpllrefclklost_quad1_out] [get_bd_pins aurora_x0y3_1/gt_qpllrefclklost_quad1]
connect_bd_net [get_bd_pins aurora_x0y3_0/gt_refclk1_out] [get_bd_pins aurora_x0y3_1/refclk1_in]
connect_bd_net [get_bd_pins aurora_x0y3_0/gt_reset_out] [get_bd_pins aurora_x0y3_1/pma_init]
connect_bd_net [get_bd_pins aurora_x0y3_0/lane_up] [get_bd_pins x0y3_core_status_0/probe_in2]
connect_bd_net [get_bd_pins aurora_x0y3_0/mmcm_not_locked_out] [get_bd_pins aurora_x0y3_1/mmcm_not_locked]
connect_bd_net [get_bd_pins aurora_x0y3_0/sync_clk_out] [get_bd_pins aurora_x0y3_1/sync_clk]
connect_bd_net [get_bd_pins aurora_x0y3_0/sys_reset_out] [get_bd_pins aurora_rstn_0/system_rst] [get_bd_pins aurora_x0y3_1/reset_pb]
connect_bd_net [get_bd_pins aurora_x0y3_0/user_clk_out] \
  [get_bd_pins user_clk_out] [get_bd_pins aurora_x0y3_1/user_clk] [get_bd_pins x0y3_core_status_0/clk] \
  [get_bd_pins x0y3_core_status_1/clk]
connect_bd_net [get_bd_pins aurora_x0y3_1/channel_up] [get_bd_pins aurora_rstn_1/channel_up] [get_bd_pins x0y3_core_status_1/probe_in0]
connect_bd_net [get_bd_pins aurora_x0y3_1/gt_pll_lock] [get_bd_pins x0y3_core_status_1/probe_in1]
connect_bd_net [get_bd_pins aurora_x0y3_1/lane_up] [get_bd_pins x0y3_core_status_1/probe_in2]
connect_bd_net [get_bd_pins aurora_x0y3_1/sys_reset_out] [get_bd_pins aurora_rstn_1/system_rst]
connect_bd_net [get_bd_pins auto_reset_aurora/reset_pb] [get_bd_pins aurora_x0y3_0/reset_pb]
connect_bd_net [get_bd_pins init_clk] [get_bd_pins auto_reset_aurora/i_clk] [get_bd_pins aurora_x0y3_0/init_clk] [get_bd_pins aurora_x0y3_1/init_clk]
connect_bd_net [get_bd_pins pma_init] [get_bd_pins aurora_x0y3_0/pma_init]

current_bd_instance /hier_rx_x0y3
connect_bd_intf_net [get_bd_intf_pins S_AXIS_RX_C0] [get_bd_intf_pins rx_c0/S_AXIS]
connect_bd_intf_net [get_bd_intf_pins S_AXIS_RX_C1] [get_bd_intf_pins rx_c1/S_AXIS]
connect_bd_intf_net [get_bd_intf_pins rx_c0/M_AXIS] [get_bd_intf_pins M_AXIS_RX_C0]
connect_bd_intf_net [get_bd_intf_pins rx_c1/M_AXIS] [get_bd_intf_pins M_AXIS_RX_C1]
connect_bd_net [get_bd_pins arstn_c0] [get_bd_pins rx_c0/s_axis_aresetn]
connect_bd_net [get_bd_pins arstn_c1] [get_bd_pins rx_c1/s_axis_aresetn]
connect_bd_net [get_bd_pins axis_aclk] [get_bd_pins rx_c0/m_axis_aclk] [get_bd_pins rx_c1/m_axis_aclk]
connect_bd_net [get_bd_pins user_clk] [get_bd_pins rx_c0/s_axis_aclk] [get_bd_pins rx_c1/s_axis_aclk]

current_bd_instance /hier_rx_x0y3/rx_c0
connect_bd_intf_net [get_bd_intf_pins S_AXIS] [get_bd_intf_pins in_fifo/S_AXIS]
connect_bd_intf_net [get_bd_intf_pins M_AXIS] [get_bd_intf_pins cdc_fifo/M_AXIS]
connect_bd_intf_net [get_bd_intf_pins header_extraction_v2_0/m_axis] [get_bd_intf_pins cdc_fifo/S_AXIS]
connect_bd_intf_net [get_bd_intf_pins in_fifo/M_AXIS] [get_bd_intf_pins header_extraction_v2_0/s_axis]
connect_bd_net [get_bd_pins m_axis_aclk] [get_bd_pins cdc_fifo/m_axis_aclk]
connect_bd_net [get_bd_pins s_axis_aclk] \
  [get_bd_pins header_extraction_v2_0/aclk] [get_bd_pins in_fifo/s_axis_aclk] [get_bd_pins cdc_fifo/s_axis_aclk]
connect_bd_net [get_bd_pins s_axis_aresetn] \
  [get_bd_pins header_extraction_v2_0/aresetn] [get_bd_pins in_fifo/s_axis_aresetn] [get_bd_pins cdc_fifo/s_axis_aresetn]

current_bd_instance /hier_rx_x0y3/rx_c1
connect_bd_intf_net [get_bd_intf_pins S_AXIS] [get_bd_intf_pins in_fifo/S_AXIS]
connect_bd_intf_net [get_bd_intf_pins M_AXIS] [get_bd_intf_pins cdc_fifo/M_AXIS]
connect_bd_intf_net [get_bd_intf_pins header_extraction_v2_0/m_axis] [get_bd_intf_pins cdc_fifo/S_AXIS]
connect_bd_intf_net [get_bd_intf_pins in_fifo/M_AXIS] [get_bd_intf_pins header_extraction_v2_0/s_axis]
connect_bd_net [get_bd_pins m_axis_aclk] [get_bd_pins cdc_fifo/m_axis_aclk]
connect_bd_net [get_bd_pins s_axis_aclk] \
  [get_bd_pins header_extraction_v2_0/aclk] [get_bd_pins in_fifo/s_axis_aclk] [get_bd_pins cdc_fifo/s_axis_aclk]
connect_bd_net [get_bd_pins s_axis_aresetn] \
  [get_bd_pins header_extraction_v2_0/aresetn] [get_bd_pins in_fifo/s_axis_aresetn] [get_bd_pins cdc_fifo/s_axis_aresetn]

current_bd_instance /hier_x0y4
connect_bd_intf_net [get_bd_intf_pins aurora_x0y4_0/GT_DIFF_REFCLK1] [get_bd_intf_pins GT_REFCLK]
connect_bd_intf_net [get_bd_intf_pins aurora_x0y4_0/GT_SERIAL_RX] [get_bd_intf_pins GT_SERIAL_RX_C0]
connect_bd_intf_net [get_bd_intf_pins aurora_x0y4_1/GT_SERIAL_RX] [get_bd_intf_pins GT_SERIAL_RX_C1]
connect_bd_intf_net [get_bd_intf_pins S_AXIS_TX_C0] [get_bd_intf_pins aurora_x0y4_0/USER_DATA_S_AXIS_TX]
connect_bd_intf_net [get_bd_intf_pins S_AXIS_TX_C1] [get_bd_intf_pins aurora_x0y4_1/USER_DATA_S_AXIS_TX]
connect_bd_intf_net [get_bd_intf_pins aurora_x0y4_0/GT_SERIAL_TX] [get_bd_intf_pins GT_SERIAL_TX_C0]
connect_bd_intf_net [get_bd_intf_pins M_AXIS_RX_C0] [get_bd_intf_pins aurora_x0y4_0/USER_DATA_M_AXIS_RX]
connect_bd_intf_net [get_bd_intf_pins aurora_x0y4_1/GT_SERIAL_TX] [get_bd_intf_pins GT_SERIAL_TX_C1]
connect_bd_intf_net [get_bd_intf_pins M_AXIS_RX_C1] [get_bd_intf_pins aurora_x0y4_1/USER_DATA_M_AXIS_RX]
connect_bd_net [get_bd_pins aurora_rstn_0/arstn] [get_bd_pins arstn_c0]
connect_bd_net [get_bd_pins aurora_rstn_1/arstn] [get_bd_pins arstn_c1]
connect_bd_net [get_bd_pins aurora_x0y4_0/channel_up] [get_bd_pins aurora_rstn_0/channel_up] [get_bd_pins x0y4_core_status_0/probe_in0]
connect_bd_net [get_bd_pins aurora_x0y4_0/gt_pll_lock] [get_bd_pins auto_reset_aurora/pll_lock] [get_bd_pins x0y4_core_status_0/probe_in1]
connect_bd_net [get_bd_pins aurora_x0y4_0/gt_qpllclk_quad1_out] [get_bd_pins aurora_x0y4_1/gt_qpllclk_quad1_in]
connect_bd_net [get_bd_pins aurora_x0y4_0/gt_qplllock_quad1_out] [get_bd_pins aurora_x0y4_1/gt_qplllock_quad1_in]
connect_bd_net [get_bd_pins aurora_x0y4_0/gt_qpllrefclk_quad1_out] [get_bd_pins aurora_x0y4_1/gt_qpllrefclk_quad1_in]
connect_bd_net [get_bd_pins aurora_x0y4_0/gt_qpllrefclklost_quad1_out] [get_bd_pins aurora_x0y4_1/gt_qpllrefclklost_quad1]
connect_bd_net [get_bd_pins aurora_x0y4_0/gt_refclk1_out] [get_bd_pins aurora_x0y4_1/refclk1_in]
connect_bd_net [get_bd_pins aurora_x0y4_0/gt_reset_out] [get_bd_pins aurora_x0y4_1/pma_init]
connect_bd_net [get_bd_pins aurora_x0y4_0/lane_up] [get_bd_pins x0y4_core_status_0/probe_in2]
connect_bd_net [get_bd_pins aurora_x0y4_0/mmcm_not_locked_out] [get_bd_pins aurora_x0y4_1/mmcm_not_locked]
connect_bd_net [get_bd_pins aurora_x0y4_0/sync_clk_out] [get_bd_pins aurora_x0y4_1/sync_clk]
connect_bd_net [get_bd_pins aurora_x0y4_0/sys_reset_out] [get_bd_pins aurora_rstn_0/system_rst] [get_bd_pins aurora_x0y4_1/reset_pb]
connect_bd_net [get_bd_pins aurora_x0y4_0/user_clk_out] \
  [get_bd_pins user_clk_out] [get_bd_pins aurora_x0y4_1/user_clk] [get_bd_pins x0y4_core_status_0/clk] \
  [get_bd_pins x0y4_core_status_1/clk]
connect_bd_net [get_bd_pins aurora_x0y4_1/channel_up] [get_bd_pins aurora_rstn_1/channel_up] [get_bd_pins x0y4_core_status_1/probe_in0]
connect_bd_net [get_bd_pins aurora_x0y4_1/gt_pll_lock] [get_bd_pins x0y4_core_status_1/probe_in1]
connect_bd_net [get_bd_pins aurora_x0y4_1/lane_up] [get_bd_pins x0y4_core_status_1/probe_in2]
connect_bd_net [get_bd_pins aurora_x0y4_1/sys_reset_out] [get_bd_pins aurora_rstn_1/system_rst]
connect_bd_net [get_bd_pins auto_reset_aurora/reset_pb] [get_bd_pins aurora_x0y4_0/reset_pb]
connect_bd_net [get_bd_pins init_clk] [get_bd_pins auto_reset_aurora/i_clk] [get_bd_pins aurora_x0y4_0/init_clk] [get_bd_pins aurora_x0y4_1/init_clk]
connect_bd_net [get_bd_pins pma_init] [get_bd_pins aurora_x0y4_0/pma_init]

current_bd_instance /hier_rx_x0y4
connect_bd_intf_net [get_bd_intf_pins S_AXIS_RX_C0] [get_bd_intf_pins rx_c0/S_AXIS]
connect_bd_intf_net [get_bd_intf_pins S_AXIS_RX_C1] [get_bd_intf_pins rx_c1/S_AXIS]
connect_bd_intf_net [get_bd_intf_pins rx_c0/M_AXIS] [get_bd_intf_pins M_AXIS_RX_C0]
connect_bd_intf_net [get_bd_intf_pins rx_c1/M_AXIS] [get_bd_intf_pins M_AXIS_RX_C1]
connect_bd_net [get_bd_pins arstn_c0] [get_bd_pins rx_c0/s_axis_aresetn]
connect_bd_net [get_bd_pins arstn_c1] [get_bd_pins rx_c1/s_axis_aresetn]
connect_bd_net [get_bd_pins axis_aclk] [get_bd_pins rx_c0/m_axis_aclk] [get_bd_pins rx_c1/m_axis_aclk]
connect_bd_net [get_bd_pins user_clk] [get_bd_pins rx_c0/s_axis_aclk] [get_bd_pins rx_c1/s_axis_aclk]

current_bd_instance /hier_rx_x0y4/rx_c0
connect_bd_intf_net [get_bd_intf_pins S_AXIS] [get_bd_intf_pins in_fifo/S_AXIS]
connect_bd_intf_net [get_bd_intf_pins M_AXIS] [get_bd_intf_pins cdc_fifo/M_AXIS]
connect_bd_intf_net [get_bd_intf_pins header_extraction_v2_0/m_axis] [get_bd_intf_pins cdc_fifo/S_AXIS]
connect_bd_intf_net [get_bd_intf_pins in_fifo/M_AXIS] [get_bd_intf_pins header_extraction_v2_0/s_axis]
connect_bd_net [get_bd_pins m_axis_aclk] [get_bd_pins cdc_fifo/m_axis_aclk]
connect_bd_net [get_bd_pins s_axis_aclk] \
  [get_bd_pins header_extraction_v2_0/aclk] [get_bd_pins in_fifo/s_axis_aclk] [get_bd_pins cdc_fifo/s_axis_aclk]
connect_bd_net [get_bd_pins s_axis_aresetn] \
  [get_bd_pins header_extraction_v2_0/aresetn] [get_bd_pins in_fifo/s_axis_aresetn] [get_bd_pins cdc_fifo/s_axis_aresetn]

current_bd_instance /hier_rx_x0y4/rx_c1
connect_bd_intf_net [get_bd_intf_pins S_AXIS] [get_bd_intf_pins in_fifo/S_AXIS]
connect_bd_intf_net [get_bd_intf_pins M_AXIS] [get_bd_intf_pins cdc_fifo/M_AXIS]
connect_bd_intf_net [get_bd_intf_pins header_extraction_v2_0/m_axis] [get_bd_intf_pins cdc_fifo/S_AXIS]
connect_bd_intf_net [get_bd_intf_pins in_fifo/M_AXIS] [get_bd_intf_pins header_extraction_v2_0/s_axis]
connect_bd_net [get_bd_pins m_axis_aclk] [get_bd_pins cdc_fifo/m_axis_aclk]
connect_bd_net [get_bd_pins s_axis_aclk] \
  [get_bd_pins header_extraction_v2_0/aclk] [get_bd_pins in_fifo/s_axis_aclk] [get_bd_pins cdc_fifo/s_axis_aclk]
connect_bd_net [get_bd_pins s_axis_aresetn] \
  [get_bd_pins header_extraction_v2_0/aresetn] [get_bd_pins in_fifo/s_axis_aresetn] [get_bd_pins cdc_fifo/s_axis_aresetn]

current_bd_instance /hier_tx_x0y3
connect_bd_intf_net [get_bd_intf_pins tx_c0/S_AXIS] [get_bd_intf_pins S_AXIS_TX_C0]
connect_bd_intf_net [get_bd_intf_pins tx_c1/S_AXIS] [get_bd_intf_pins S_AXIS_TX_C1]
connect_bd_intf_net [get_bd_intf_pins M_AXIS_TX_C0] [get_bd_intf_pins tx_c0/M_AXIS]
connect_bd_intf_net [get_bd_intf_pins M_AXIS_TX_C1] [get_bd_intf_pins tx_c1/M_AXIS]
connect_bd_net [get_bd_pins arstn_c0] [get_bd_pins tx_c0/m_axis_aresetn] [get_bd_pins axis_rst_sync_c0/src_arst]
connect_bd_net [get_bd_pins arstn_c1] [get_bd_pins tx_c1/m_axis_aresetn] [get_bd_pins axis_rst_sync_c1/src_arst]
connect_bd_net [get_bd_pins axis_aclk] \
  [get_bd_pins tx_c0/s_axis_aclk] [get_bd_pins tx_c1/s_axis_aclk] [get_bd_pins axis_rst_sync_c0/dest_clk] \
  [get_bd_pins axis_rst_sync_c1/dest_clk]
connect_bd_net [get_bd_pins axis_rst_sync_c0/dest_arst] [get_bd_pins axis_arstn_c0] [get_bd_pins tx_c0/s_axis_aresetn]
connect_bd_net [get_bd_pins axis_rst_sync_c1/dest_arst] [get_bd_pins axis_arstn_c1] [get_bd_pins tx_c1/s_axis_aresetn]
connect_bd_net [get_bd_pins user_clk] [get_bd_pins tx_c0/m_axis_aclk] [get_bd_pins tx_c1/m_axis_aclk]

current_bd_instance /hier_tx_x0y3/tx_c0
connect_bd_intf_net [get_bd_intf_pins S_AXIS] [get_bd_intf_pins cdc_fifo/S_AXIS]
connect_bd_intf_net [get_bd_intf_pins cdc_fifo/M_AXIS] [get_bd_intf_pins header_insertion_v2_0/s_axis]
connect_bd_intf_net [get_bd_intf_pins header_insertion_v2_0/m_axis] [get_bd_intf_pins out_fifo/S_AXIS]
connect_bd_intf_net [get_bd_intf_pins M_AXIS] [get_bd_intf_pins out_fifo/M_AXIS]
connect_bd_net [get_bd_pins m_axis_aclk] \
  [get_bd_pins header_insertion_v2_0/aclk] [get_bd_pins cdc_fifo/m_axis_aclk] [get_bd_pins out_fifo/s_axis_aclk]
connect_bd_net [get_bd_pins m_axis_aresetn] [get_bd_pins header_insertion_v2_0/aresetn] [get_bd_pins out_fifo/s_axis_aresetn]
connect_bd_net [get_bd_pins s_axis_aclk] [get_bd_pins cdc_fifo/s_axis_aclk]
connect_bd_net [get_bd_pins s_axis_aresetn] [get_bd_pins cdc_fifo/s_axis_aresetn]

current_bd_instance /hier_tx_x0y3/tx_c1
connect_bd_intf_net [get_bd_intf_pins S_AXIS] [get_bd_intf_pins cdc_fifo/S_AXIS]
connect_bd_intf_net [get_bd_intf_pins cdc_fifo/M_AXIS] [get_bd_intf_pins header_insertion_v2_0/s_axis]
connect_bd_intf_net [get_bd_intf_pins header_insertion_v2_0/m_axis] [get_bd_intf_pins out_fifo/S_AXIS]
connect_bd_intf_net [get_bd_intf_pins M_AXIS] [get_bd_intf_pins out_fifo/M_AXIS]
connect_bd_net [get_bd_pins m_axis_aclk] \
  [get_bd_pins header_insertion_v2_0/aclk] [get_bd_pins cdc_fifo/m_axis_aclk] [get_bd_pins out_fifo/s_axis_aclk]
connect_bd_net [get_bd_pins m_axis_aresetn] [get_bd_pins header_insertion_v2_0/aresetn] [get_bd_pins out_fifo/s_axis_aresetn]
connect_bd_net [get_bd_pins s_axis_aclk] [get_bd_pins cdc_fifo/s_axis_aclk]
connect_bd_net [get_bd_pins s_axis_aresetn] [get_bd_pins cdc_fifo/s_axis_aresetn]

current_bd_instance /hier_tx_x0y4
connect_bd_intf_net [get_bd_intf_pins tx_c0/S_AXIS] [get_bd_intf_pins S_AXIS_TX_C0]
connect_bd_intf_net [get_bd_intf_pins tx_c1/S_AXIS] [get_bd_intf_pins S_AXIS_TX_C1]
connect_bd_intf_net [get_bd_intf_pins M_AXIS_TX_C0] [get_bd_intf_pins tx_c0/M_AXIS]
connect_bd_intf_net [get_bd_intf_pins M_AXIS_TX_C1] [get_bd_intf_pins tx_c1/M_AXIS]
connect_bd_net [get_bd_pins arstn_c0] [get_bd_pins tx_c0/m_axis_aresetn] [get_bd_pins axis_rst_sync_c0/src_arst]
connect_bd_net [get_bd_pins arstn_c1] [get_bd_pins tx_c1/m_axis_aresetn] [get_bd_pins axis_rst_sync_c1/src_arst]
connect_bd_net [get_bd_pins axis_aclk] \
  [get_bd_pins tx_c0/s_axis_aclk] [get_bd_pins tx_c1/s_axis_aclk] [get_bd_pins axis_rst_sync_c0/dest_clk] \
  [get_bd_pins axis_rst_sync_c1/dest_clk]
connect_bd_net [get_bd_pins axis_rst_sync_c0/dest_arst] [get_bd_pins axis_arstn_c0] [get_bd_pins tx_c0/s_axis_aresetn]
connect_bd_net [get_bd_pins axis_rst_sync_c1/dest_arst] [get_bd_pins axis_arstn_c1] [get_bd_pins tx_c1/s_axis_aresetn]
connect_bd_net [get_bd_pins user_clk] [get_bd_pins tx_c0/m_axis_aclk] [get_bd_pins tx_c1/m_axis_aclk]

current_bd_instance /hier_tx_x0y4/tx_c0
connect_bd_intf_net [get_bd_intf_pins S_AXIS] [get_bd_intf_pins cdc_fifo/S_AXIS]
connect_bd_intf_net [get_bd_intf_pins cdc_fifo/M_AXIS] [get_bd_intf_pins header_insertion_v2_0/s_axis]
connect_bd_intf_net [get_bd_intf_pins header_insertion_v2_0/m_axis] [get_bd_intf_pins out_fifo/S_AXIS]
connect_bd_intf_net [get_bd_intf_pins M_AXIS] [get_bd_intf_pins out_fifo/M_AXIS]
connect_bd_net [get_bd_pins m_axis_aclk] \
  [get_bd_pins header_insertion_v2_0/aclk] [get_bd_pins cdc_fifo/m_axis_aclk] [get_bd_pins out_fifo/s_axis_aclk]
connect_bd_net [get_bd_pins m_axis_aresetn] [get_bd_pins header_insertion_v2_0/aresetn] [get_bd_pins out_fifo/s_axis_aresetn]
connect_bd_net [get_bd_pins s_axis_aclk] [get_bd_pins cdc_fifo/s_axis_aclk]
connect_bd_net [get_bd_pins s_axis_aresetn] [get_bd_pins cdc_fifo/s_axis_aresetn]

current_bd_instance /hier_tx_x0y4/tx_c1
connect_bd_intf_net [get_bd_intf_pins S_AXIS] [get_bd_intf_pins cdc_fifo/S_AXIS]
connect_bd_intf_net [get_bd_intf_pins cdc_fifo/M_AXIS] [get_bd_intf_pins header_insertion_v2_0/s_axis]
connect_bd_intf_net [get_bd_intf_pins header_insertion_v2_0/m_axis] [get_bd_intf_pins out_fifo/S_AXIS]
connect_bd_intf_net [get_bd_intf_pins M_AXIS] [get_bd_intf_pins out_fifo/M_AXIS]
connect_bd_net [get_bd_pins m_axis_aclk] \
  [get_bd_pins header_insertion_v2_0/aclk] [get_bd_pins cdc_fifo/m_axis_aclk] [get_bd_pins out_fifo/s_axis_aclk]
connect_bd_net [get_bd_pins m_axis_aresetn] [get_bd_pins header_insertion_v2_0/aresetn] [get_bd_pins out_fifo/s_axis_aresetn]
connect_bd_net [get_bd_pins s_axis_aclk] [get_bd_pins cdc_fifo/s_axis_aclk]
connect_bd_net [get_bd_pins s_axis_aresetn] [get_bd_pins cdc_fifo/s_axis_aresetn]

current_bd_instance /
connect_bd_intf_net [get_bd_intf_ports GT_SERIAL_RX_X0Y1_C0] [get_bd_intf_pins hier_x0y1/GT_SERIAL_RX_C0]
connect_bd_intf_net [get_bd_intf_ports GT_SERIAL_RX_X0Y1_C1] [get_bd_intf_pins hier_x0y1/GT_SERIAL_RX_C1]
connect_bd_intf_net [get_bd_intf_ports GT_SERIAL_RX_X0Y2_C0] [get_bd_intf_pins hier_x0y2/GT_SERIAL_RX_C0]
connect_bd_intf_net [get_bd_intf_ports GT_SERIAL_RX_X0Y2_C1] [get_bd_intf_pins hier_x0y2/GT_SERIAL_RX_C1]
connect_bd_intf_net [get_bd_intf_ports GT_SERIAL_RX_X0Y3_C0] [get_bd_intf_pins hier_x0y3/GT_SERIAL_RX_C0]
connect_bd_intf_net [get_bd_intf_ports GT_SERIAL_RX_X0Y3_C1] [get_bd_intf_pins hier_x0y3/GT_SERIAL_RX_C1]
connect_bd_intf_net [get_bd_intf_ports GT_SERIAL_RX_X0Y4_C0] [get_bd_intf_pins hier_x0y4/GT_SERIAL_RX_C0]
connect_bd_intf_net [get_bd_intf_ports GT_SERIAL_RX_X0Y4_C1] [get_bd_intf_pins hier_x0y4/GT_SERIAL_RX_C1]
connect_bd_intf_net [get_bd_intf_ports S_AXIS_X0Y1_C0] [get_bd_intf_pins hier_tx_x0y1/S_AXIS_TX_C0]
connect_bd_intf_net [get_bd_intf_ports S_AXIS_X0Y1_C1] [get_bd_intf_pins hier_tx_x0y1/S_AXIS_TX_C1]
connect_bd_intf_net [get_bd_intf_ports S_AXIS_X0Y2_C0] [get_bd_intf_pins hier_tx_x0y2/S_AXIS_TX_C0]
connect_bd_intf_net [get_bd_intf_ports S_AXIS_X0Y2_C1] [get_bd_intf_pins hier_tx_x0y2/S_AXIS_TX_C1]
connect_bd_intf_net [get_bd_intf_ports S_AXIS_X0Y3_C0] [get_bd_intf_pins hier_tx_x0y3/S_AXIS_TX_C0]
connect_bd_intf_net [get_bd_intf_ports S_AXIS_X0Y3_C1] [get_bd_intf_pins hier_tx_x0y3/S_AXIS_TX_C1]
connect_bd_intf_net [get_bd_intf_ports S_AXIS_X0Y4_C0] [get_bd_intf_pins hier_tx_x0y4/S_AXIS_TX_C0]
connect_bd_intf_net [get_bd_intf_ports S_AXIS_X0Y4_C1] [get_bd_intf_pins hier_tx_x0y4/S_AXIS_TX_C1]
connect_bd_intf_net [get_bd_intf_ports gt_x0y1_diff_ref] [get_bd_intf_pins hier_x0y1/GT_REFCLK]
connect_bd_intf_net [get_bd_intf_ports gt_x0y2_diff_ref] [get_bd_intf_pins hier_x0y2/GT_REFCLK]
connect_bd_intf_net [get_bd_intf_ports gt_x0y3_diff_ref] [get_bd_intf_pins hier_x0y3/GT_REFCLK]
connect_bd_intf_net [get_bd_intf_ports gt_x0y4_diff_ref] [get_bd_intf_pins hier_x0y4/GT_REFCLK]
connect_bd_intf_net [get_bd_intf_ports M_AXIS_X0Y1_C0] [get_bd_intf_pins hier_rx_x0y1/M_AXIS_RX_C0]
connect_bd_intf_net [get_bd_intf_ports M_AXIS_X0Y1_C1] [get_bd_intf_pins hier_rx_x0y1/M_AXIS_RX_C1]
connect_bd_intf_net [get_bd_intf_ports M_AXIS_X0Y2_C0] [get_bd_intf_pins hier_rx_x0y2/M_AXIS_RX_C0]
connect_bd_intf_net [get_bd_intf_ports M_AXIS_X0Y2_C1] [get_bd_intf_pins hier_rx_x0y2/M_AXIS_RX_C1]
connect_bd_intf_net [get_bd_intf_ports M_AXIS_X0Y3_C0] [get_bd_intf_pins hier_rx_x0y3/M_AXIS_RX_C0]
connect_bd_intf_net [get_bd_intf_ports M_AXIS_X0Y3_C1] [get_bd_intf_pins hier_rx_x0y3/M_AXIS_RX_C1]
connect_bd_intf_net [get_bd_intf_ports M_AXIS_X0Y4_C0] [get_bd_intf_pins hier_rx_x0y4/M_AXIS_RX_C0]
connect_bd_intf_net [get_bd_intf_ports M_AXIS_X0Y4_C1] [get_bd_intf_pins hier_rx_x0y4/M_AXIS_RX_C1]
connect_bd_intf_net [get_bd_intf_pins hier_tx_x0y1/M_AXIS_TX_C0] [get_bd_intf_pins hier_x0y1/S_AXIS_TX_C0]
connect_bd_intf_net [get_bd_intf_pins hier_tx_x0y1/M_AXIS_TX_C0] [get_bd_intf_pins ila_x0y1/SLOT_0_AXIS]
connect_bd_intf_net [get_bd_intf_pins hier_tx_x0y1/M_AXIS_TX_C1] [get_bd_intf_pins hier_x0y1/S_AXIS_TX_C1]
connect_bd_intf_net [get_bd_intf_pins hier_tx_x0y1/M_AXIS_TX_C1] [get_bd_intf_pins ila_x0y1/SLOT_1_AXIS]
connect_bd_intf_net [get_bd_intf_pins hier_tx_x0y2/M_AXIS_TX_C0] [get_bd_intf_pins hier_x0y2/S_AXIS_TX_C0]
connect_bd_intf_net [get_bd_intf_pins hier_tx_x0y2/M_AXIS_TX_C0] [get_bd_intf_pins ila_x0y2/SLOT_0_AXIS]
connect_bd_intf_net [get_bd_intf_pins hier_x0y2/S_AXIS_TX_C1] [get_bd_intf_pins hier_tx_x0y2/M_AXIS_TX_C1]
connect_bd_intf_net [get_bd_intf_pins hier_x0y2/S_AXIS_TX_C1] [get_bd_intf_pins ila_x0y2/SLOT_1_AXIS]
connect_bd_intf_net [get_bd_intf_pins hier_tx_x0y3/M_AXIS_TX_C0] [get_bd_intf_pins hier_x0y3/S_AXIS_TX_C0]
connect_bd_intf_net [get_bd_intf_pins hier_tx_x0y3/M_AXIS_TX_C0] [get_bd_intf_pins ila_x0y3/SLOT_0_AXIS]
connect_bd_intf_net [get_bd_intf_pins hier_tx_x0y3/M_AXIS_TX_C1] [get_bd_intf_pins hier_x0y3/S_AXIS_TX_C1]
connect_bd_intf_net [get_bd_intf_pins hier_tx_x0y3/M_AXIS_TX_C1] [get_bd_intf_pins ila_x0y3/SLOT_1_AXIS]
connect_bd_intf_net [get_bd_intf_pins hier_tx_x0y4/M_AXIS_TX_C0] [get_bd_intf_pins hier_x0y4/S_AXIS_TX_C0]
connect_bd_intf_net [get_bd_intf_pins hier_tx_x0y4/M_AXIS_TX_C0] [get_bd_intf_pins ila_x0y4/SLOT_0_AXIS]
connect_bd_intf_net [get_bd_intf_pins hier_tx_x0y4/M_AXIS_TX_C1] [get_bd_intf_pins hier_x0y4/S_AXIS_TX_C1]
connect_bd_intf_net [get_bd_intf_pins hier_tx_x0y4/M_AXIS_TX_C1] [get_bd_intf_pins ila_x0y4/SLOT_1_AXIS]
connect_bd_intf_net [get_bd_intf_ports GT_SERIAL_TX_X0Y1_C0] [get_bd_intf_pins hier_x0y1/GT_SERIAL_TX_C0]
connect_bd_intf_net [get_bd_intf_ports GT_SERIAL_TX_X0Y1_C1] [get_bd_intf_pins hier_x0y1/GT_SERIAL_TX_C1]
connect_bd_intf_net [get_bd_intf_pins hier_x0y1/M_AXIS_RX_C0] [get_bd_intf_pins hier_rx_x0y1/S_AXIS_RX_C0]
connect_bd_intf_net [get_bd_intf_pins hier_x0y1/M_AXIS_RX_C0] [get_bd_intf_pins ila_x0y1/SLOT_2_AXIS]
connect_bd_intf_net [get_bd_intf_pins hier_x0y1/M_AXIS_RX_C1] [get_bd_intf_pins hier_rx_x0y1/S_AXIS_RX_C1]
connect_bd_intf_net [get_bd_intf_pins hier_x0y1/M_AXIS_RX_C1] [get_bd_intf_pins ila_x0y1/SLOT_3_AXIS]
connect_bd_intf_net [get_bd_intf_ports GT_SERIAL_TX_X0Y2_C0] [get_bd_intf_pins hier_x0y2/GT_SERIAL_TX_C0]
connect_bd_intf_net [get_bd_intf_ports GT_SERIAL_TX_X0Y2_C1] [get_bd_intf_pins hier_x0y2/GT_SERIAL_TX_C1]
connect_bd_intf_net [get_bd_intf_pins hier_x0y2/M_AXIS_RX_C0] [get_bd_intf_pins hier_rx_x0y2/S_AXIS_RX_C0]
connect_bd_intf_net [get_bd_intf_pins hier_x0y2/M_AXIS_RX_C0] [get_bd_intf_pins ila_x0y2/SLOT_2_AXIS]
connect_bd_intf_net [get_bd_intf_pins hier_x0y2/M_AXIS_RX_C1] [get_bd_intf_pins hier_rx_x0y2/S_AXIS_RX_C1]
connect_bd_intf_net [get_bd_intf_pins hier_x0y2/M_AXIS_RX_C1] [get_bd_intf_pins ila_x0y2/SLOT_3_AXIS]
connect_bd_intf_net [get_bd_intf_ports GT_SERIAL_TX_X0Y3_C0] [get_bd_intf_pins hier_x0y3/GT_SERIAL_TX_C0]
connect_bd_intf_net [get_bd_intf_ports GT_SERIAL_TX_X0Y3_C1] [get_bd_intf_pins hier_x0y3/GT_SERIAL_TX_C1]
connect_bd_intf_net [get_bd_intf_pins hier_x0y3/M_AXIS_RX_C0] [get_bd_intf_pins hier_rx_x0y3/S_AXIS_RX_C0]
connect_bd_intf_net [get_bd_intf_pins hier_x0y3/M_AXIS_RX_C0] [get_bd_intf_pins ila_x0y3/SLOT_2_AXIS]
connect_bd_intf_net [get_bd_intf_pins hier_x0y3/M_AXIS_RX_C1] [get_bd_intf_pins hier_rx_x0y3/S_AXIS_RX_C1]
connect_bd_intf_net [get_bd_intf_pins hier_x0y3/M_AXIS_RX_C1] [get_bd_intf_pins ila_x0y3/SLOT_3_AXIS]
connect_bd_intf_net [get_bd_intf_ports GT_SERIAL_TX_X0Y4_C0] [get_bd_intf_pins hier_x0y4/GT_SERIAL_TX_C0]
connect_bd_intf_net [get_bd_intf_ports GT_SERIAL_TX_X0Y4_C1] [get_bd_intf_pins hier_x0y4/GT_SERIAL_TX_C1]
connect_bd_intf_net [get_bd_intf_pins hier_x0y4/M_AXIS_RX_C0] [get_bd_intf_pins hier_rx_x0y4/S_AXIS_RX_C0]
connect_bd_intf_net [get_bd_intf_pins hier_x0y4/M_AXIS_RX_C0] [get_bd_intf_pins ila_x0y4/SLOT_2_AXIS]
connect_bd_intf_net [get_bd_intf_pins hier_x0y4/M_AXIS_RX_C1] [get_bd_intf_pins hier_rx_x0y4/S_AXIS_RX_C1]
connect_bd_intf_net [get_bd_intf_pins hier_x0y4/M_AXIS_RX_C1] [get_bd_intf_pins ila_x0y4/SLOT_3_AXIS]
connect_bd_net [get_bd_pins hier_x0y1/arstn_c0] [get_bd_pins hier_rx_x0y1/arstn_c0] [get_bd_pins hier_tx_x0y1/arstn_c0]
connect_bd_net [get_bd_pins hier_x0y1/arstn_c1] [get_bd_pins hier_tx_x0y1/arstn_c1] [get_bd_pins hier_rx_x0y1/arstn_c1]
connect_bd_net [get_bd_pins hier_x0y1/user_clk_out] [get_bd_pins hier_tx_x0y1/user_clk] [get_bd_pins hier_rx_x0y1/user_clk] [get_bd_pins ila_x0y1/clk]
connect_bd_net [get_bd_pins hier_x0y2/arstn_c0] [get_bd_pins hier_tx_x0y2/arstn_c0] [get_bd_pins hier_rx_x0y2/arstn_c0]
connect_bd_net [get_bd_pins hier_x0y2/arstn_c1] [get_bd_pins hier_rx_x0y2/arstn_c1] [get_bd_pins hier_tx_x0y2/arstn_c1]
connect_bd_net [get_bd_pins hier_x0y2/user_clk_out] [get_bd_pins hier_tx_x0y2/user_clk] [get_bd_pins hier_rx_x0y2/user_clk] [get_bd_pins ila_x0y2/clk]
connect_bd_net [get_bd_pins hier_x0y3/arstn_c0] [get_bd_pins hier_tx_x0y3/arstn_c0] [get_bd_pins hier_rx_x0y3/arstn_c0]
connect_bd_net [get_bd_pins hier_x0y3/arstn_c1] [get_bd_pins hier_rx_x0y3/arstn_c1] [get_bd_pins hier_tx_x0y3/arstn_c1]
connect_bd_net [get_bd_pins hier_x0y3/user_clk_out] [get_bd_pins hier_tx_x0y3/user_clk] [get_bd_pins hier_rx_x0y3/user_clk] [get_bd_pins ila_x0y3/clk]
connect_bd_net [get_bd_pins hier_x0y4/arstn_c0] [get_bd_pins hier_tx_x0y4/arstn_c0] [get_bd_pins hier_rx_x0y4/arstn_c0]
connect_bd_net [get_bd_pins hier_x0y4/arstn_c1] [get_bd_pins hier_rx_x0y4/arstn_c1] [get_bd_pins hier_tx_x0y4/arstn_c1]
connect_bd_net [get_bd_pins hier_x0y4/user_clk_out] [get_bd_pins hier_tx_x0y4/user_clk] [get_bd_pins hier_rx_x0y4/user_clk] [get_bd_pins ila_x0y4/clk]
connect_bd_net [get_bd_ports ini_pma_rst] [get_bd_pins ini_system_0/i_pma_rst]
connect_bd_net [get_bd_pins ini_system_0/ini_pma] \
  [get_bd_pins hier_x0y1/pma_init] [get_bd_pins hier_x0y2/pma_init] [get_bd_pins hier_x0y3/pma_init] \
  [get_bd_pins hier_x0y4/pma_init]
connect_bd_net [get_bd_ports init_clk] \
  [get_bd_pins hier_x0y1/init_clk] [get_bd_pins ini_system_0/i_clk] [get_bd_pins hier_x0y2/init_clk] \
  [get_bd_pins hier_x0y3/init_clk] [get_bd_pins hier_x0y4/init_clk]
connect_bd_net [get_bd_ports s_axis_aclk] \
  [get_bd_pins hier_tx_x0y2/axis_aclk] [get_bd_pins hier_tx_x0y1/axis_aclk] [get_bd_pins hier_rx_x0y1/axis_aclk] \
  [get_bd_pins hier_rx_x0y2/axis_aclk] [get_bd_pins hier_rx_x0y3/axis_aclk] [get_bd_pins hier_rx_x0y4/axis_aclk] \
  [get_bd_pins hier_tx_x0y3/axis_aclk] [get_bd_pins hier_tx_x0y4/axis_aclk]
